# Altium project FT8.PrjPcb
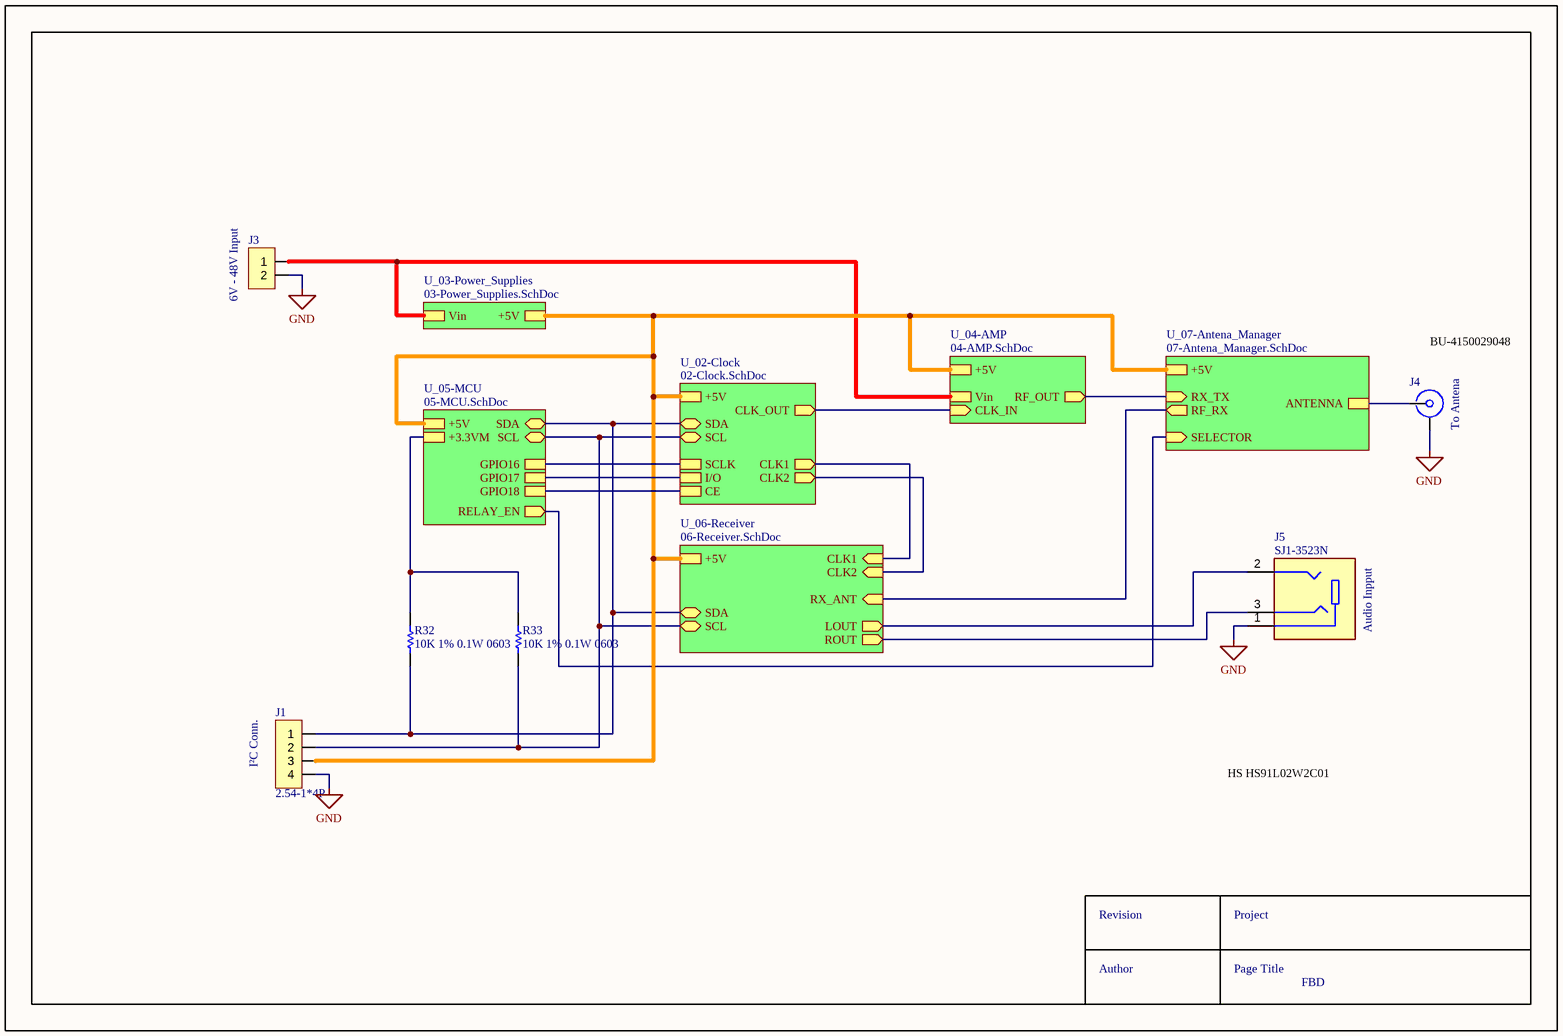
[diagram p0: 01-FBD.SchDoc]
AUTHOR_NAME: CallMeC; BOM_Revision: A; IndusFiles_Revision: 001_A; PCB_Revision: 001_A; Project_Name: RP2040 FT8 TRX; REVISION_VALUE: 001_A
7 sheets, 161 parts. Net scope: hierarchical (ports join the sheet entries above them; power ports are global).
Board file: FT8.PcbDoc
Sheets:
  01-FBD.SchDoc
    U_02-Clock = 02-Clock.SchDoc
    U_04-AMP = 04-AMP.SchDoc
    U_05-MCU = 05-MCU.SchDoc
    U_03-Power_Supplies = 03-Power_Supplies.SchDoc
    U_06-Receiver = 06-Receiver.SchDoc
    U_07-Antena_Manager = 07-Antena_Manager.SchDoc

## Sheet 01-FBD.SchDoc: FBD
size A4; Author: CallMeC; Organization: ORGANIZATION; Address1: ADDRESS 1; Address2: ADDRESS 2; Address3: ADDRESS 3; Address4: ADDRESS 4; Revision: 001_A; SheetNumber: 1; SheetTotal: 7; Title2: OK; Project: RP2040 FT8 TRX; ENG_APP_DATE: --/--/--; DSN_APP_DATE: --/--/--; CHK_APP_DATE: --/--/--

### Parts
J1  2.54-1*4P  [FP-87224-3-MFG]
J3  MX635-6.35-02P-GN01-Cu-PS-A  [MX635-6.35-02P-GN01-Cu-PS-A-Footprint-1]  (value not drawn)
J4  BWSMA-KE-P001  [TE_CONSMA020.062-G]  (value not drawn)
J5  SJ1-3523N  [CUI_SJ1-3523N]
R32  10K 1% 0.1W 0603  [R0603]
R33  10K 1% 0.1W 0603  [R0603]

### Sub-sheets
U_02-Clock = 02-Clock.SchDoc: +5V, SDA (bidir), SCL (bidir), CLK_OUT (out), SCLK, I/O, CE, CLK1 (out), CLK2 (out)
U_03-Power_Supplies = 03-Power_Supplies.SchDoc: Vin, +5V
U_04-AMP = 04-AMP.SchDoc: CLK_IN (in), Vin, RF_OUT (out), +5V
U_05-MCU = 05-MCU.SchDoc: SDA (bidir), SCL (bidir), RELAY_EN (out), +5V, GPIO16, GPIO17, GPIO18, +3.3VM
U_06-Receiver = 06-Receiver.SchDoc: +5V, RX_ANT (in), SDA (bidir), SCL (bidir), LOUT (out), ROUT (out), CLK1 (in), CLK2 (in)
U_07-Antena_Manager = 07-Antena_Manager.SchDoc: RF_RX (out), RX_TX (in), ANTENNA, +5V, SELECTOR (in)

### Nets
ADC_AVDD: R32.2 R33.2 ; sheet U_05-MCU/+3.3VM
GND: J1.4 J3.2 J4.G J5.1
NetC1_2: J1.3 ; sheet U_02-Clock/+5V, sheet U_04-AMP/+5V, sheet U_05-MCU/+5V, sheet U_03-Power_Supplies/+5V, sheet U_06-Receiver/+5V, sheet U_07-Antena_Manager/+5V
NetC8_2: J3.1 ; sheet U_04-AMP/Vin, sheet U_03-Power_Supplies/Vin
NetC24_1: sheet U_04-AMP/RF_OUT, sheet U_07-Antena_Manager/RX_TX
NetC35_2: J5.2 ; sheet U_06-Receiver/LOUT
NetC37_2: J5.3 ; sheet U_06-Receiver/ROUT
NetC68_1: J4.1 ; sheet U_07-Antena_Manager/ANTENNA
NetJ1_1: J1.1 R32.1 ; sheet U_02-Clock/SDA, sheet U_05-MCU/SDA, sheet U_06-Receiver/SDA
NetJ1_2: J1.2 R33.1 ; sheet U_02-Clock/SCL, sheet U_05-MCU/SCL, sheet U_06-Receiver/SCL
NetK1_NC: sheet U_06-Receiver/RX_ANT, sheet U_07-Antena_Manager/RF_RX
NetR19_1: sheet U_05-MCU/RELAY_EN, sheet U_07-Antena_Manager/SELECTOR
NetTP6_0: sheet U_02-Clock/CLK_OUT, sheet U_04-AMP/CLK_IN
NetU2_6: sheet U_02-Clock/CLK2, sheet U_06-Receiver/CLK2
NetU2_9: sheet U_02-Clock/CLK1, sheet U_06-Receiver/CLK1
NetU3_5: sheet U_02-Clock/CE, sheet U_05-MCU/GPIO18
NetU3_6: sheet U_02-Clock/I/O, sheet U_05-MCU/GPIO17
NetU3_7: sheet U_02-Clock/SCLK, sheet U_05-MCU/GPIO16

### Notes on the sheet
- (near J3) 6V - 48V Input
- BU-4150029048
- (near J4) To Antena
- Audio Inpput
- (near J1) I²C Conn.
- HS HS91L02W2C01
- Revision
- Project
- Author
- Page Title

### Library data of the parts
J1 = CMP-002-00121-1: 2.54mm Single Row 3A 4P Bronze -40℃~+105℃ Direct Insert 1x4P Top Square Hole Plugin,P=2.54mm Female Headers ROHS; MFR: BOOMELE(Boom Precision Elec); MFR_Part_#: 2.54-1*4P; LCSC_Part_#: C2718488; LCSC_Price_1ku: 0.026
J3 = CMP-002-00092-2: Copper Alloy 1x2P Tin 6.35mm 4 1 2 -40℃~+105℃ 30A 300V Green 10~26 Straight Plugin,P=6.35mm Screw terminal ROHS; MFR_Part_#: MX635-6.35-02P-GN01-Cu-PS-A; LCSC_Price_1ku: 0.1045; LCSC_Part_#: C5188489
J4 = CMP-543-000000-2: 1 Inner Hole SMA Board-End Staggered pins 50Ω 5.2mm SMD Coaxial Connectors (RF) ROHS; MFR: BAT WIRELESS; MFR_Part_#: BWSMA-KE-P001; LCSC_Price_1lu: 0.2065; LCSC_Part_#: C496550
J5 = CMP-545-000000-2: 3.5 mm, Stereo, Right Angle, Through Hole, 3 Conductors, 0 Internal Switches, Audio Jack Connector; MFR: CUI; LCSC_Part_#: C20182914; LCSC_Price_1ku: 0.6476; MFR_Part_#: SJ1-3523N
R32 R33 = CMP-356-000043-3: Standard Resistor 10K 1% 0.1W 0603; Manufacturer: Generic; MFR_Part_#: 0603WAF1002T5E; TC: 200; Design Item ID: 10K 1% 0.1W 0603; Tolerance: 1%; LCSC_Price_1ku: 0.0007; Value: 10K; PartNumber: 10K 1% 0.1W 0603; LCSC_Part_#: C25804; Component Type: Standard; Source: GT_WH_Control.SCHLIB; Pin Count: 2; Power: 0.1W

## Sheet 02-Clock.SchDoc: Clock
size A4; Author: CallMeC; Organization: ORGANIZATION; Address1: ADDRESS 1; Address2: ADDRESS 2; Address3: ADDRESS 3; Address4: ADDRESS 4; Revision: 001_A; SheetNumber: 2; SheetTotal: 7; Project: RP2040 FT8 TRX; ENG_APP_DATE: --/--/--; DSN_APP_DATE: --/--/--; CHK_APP_DATE: --/--/--
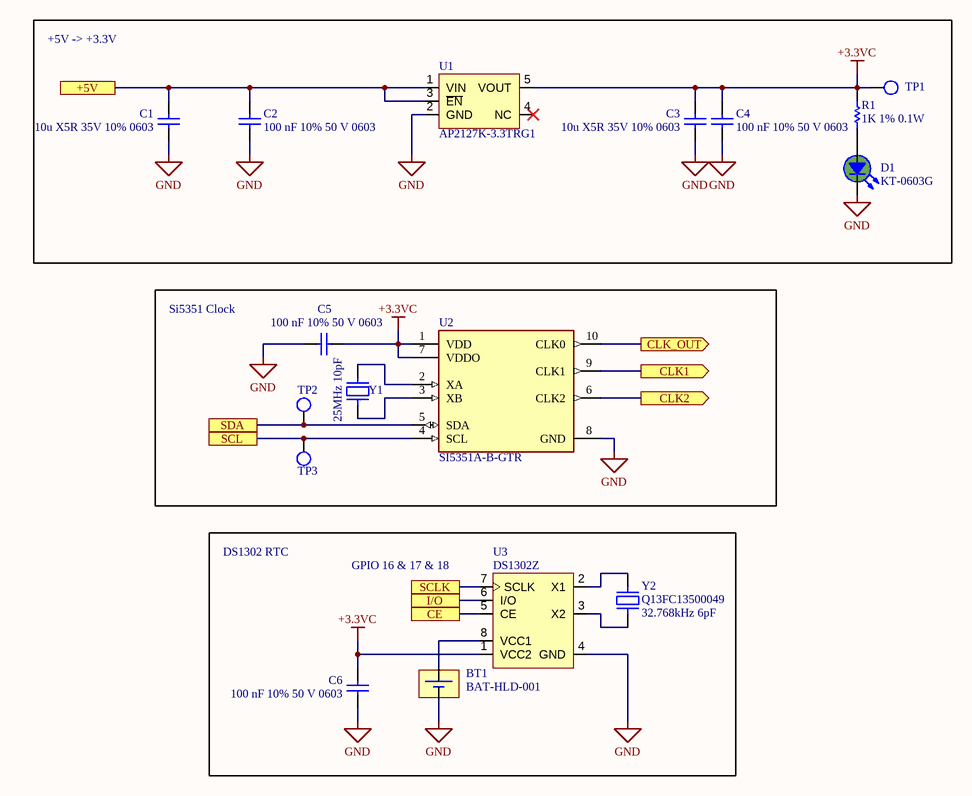
[diagram p1: 02-Clock.SchDoc]

### Parts
BT1  BAT-HLD-001  [BATHLD-001]
C1  10u X5R 35V 10% 0603  [C0603]
C2  100 nF 10% 50 V 0603  [CAPC1608X90X40NL10T20]
C3  10u X5R 35V 10% 0603  [C0603]
C4  100 nF 10% 50 V 0603  [CAPC1608X90X40NL10T20]
C5  100 nF 10% 50 V 0603  [CAPC1608X90X40NL10T20]
C6  100 nF 10% 50 V 0603  [CAPC1608X90X40NL10T20]
D1  KT-0603G  [LED-0603-RED]
R1  1K 1% 0.1W  [R0603]
TP1  Touchpoint  [Touchpoint-Footprint-1]  (value not drawn)  (no BOM)
TP2  Touchpoint  [Touchpoint-Footprint-1]  (value not drawn)  (no BOM)
TP3  Touchpoint  [Touchpoint-Footprint-1]  (value not drawn)  (no BOM)
U1  AP2127K-3.3TRG1  [FP-SOT25-IPC_B]
U2  SI5351A-B-GTR  [FP-SI5351A-B-GTR-IPC_B]
U3  DS1302Z  [SO8]
Y1  value 25MHz 10pF  [X50328MSB2GI-Footprint-1]  (hidden comment: XG1EL89CKI-111YLC-25M)
Y2  Q13FC13500049  value 32.768kHz 6pF  [FP-ABS07-120-MFG]

### Blocks framed on the sheet
+5V -> +3.3V: C1-C4 D1 R1 TP1 U1
Si5351 Clock: C5 TP2 TP3 U2 Y1

### Ports
+5V, CE, CLK1 (out), CLK2 (out), CLK_OUT (out), I/O, SCL, SCLK, SDA

### Nets
+3.3VC: C3.2 C4.2 C5.1 C6.1 R1.1 TP1.0 U1.5(VOUT) U2.1(VDD) U2.7(VDDO) U3.1(VCC2)
GND: BT1.1(-) C1.1 C2.1 C3.1 C4.1 C5.2 C6.2 D1.2 U1.2(GND) U2.8(GND) U3.4(GND)
NetBT1_2: BT1.2(+) U3.8(VCC1)
NetC1_2: C1.2 C2.2 U1.1(VIN) U1.3(~{EN}) ; port +5V
NetD1_1: D1.1 R1.2
NetJ1_1: TP2.0 U2.5(SDA) ; port SDA
NetJ1_2: TP3.0 U2.4(SCL) ; port SCL
NetTP6_0: U2.10(CLK0) ; port CLK_OUT
NetU2_2: U2.2(XA) Y1.2
NetU2_3: U2.3(XB) Y1.1
NetU2_6: U2.6(CLK2) ; port CLK2
NetU2_9: U2.9(CLK1) ; port CLK1
NetU3_2: U3.2(X1) Y2.2
NetU3_3: U3.3(X2) Y2.1
NetU3_5: U3.5(CE) ; port CE
NetU3_6: U3.6(I/O) ; port I/O
NetU3_7: U3.7(SCLK) ; port SCLK

Not connected (* = marked no-connect by the designer): U1 4(NC)*

### Notes on the sheet
- DS1302 RTC
- (near U3) GPIO 16 & 17 & 18
- Revision
- Project
- Author
- Page Title

### Library data of the parts
BT1 = CMP-002-00120-1: CR2032 Phosphor Bronze / Nickel Plated 20 mm Cell Size Battery Holder; MFR: TE Connectivity; LCSC_Price_1ku: 0.4659; MFR_Part_#: BAT-HLD-001; LCSC_Part_#: C7501066
C1 C3 = CMP-001-00153-3: MLCC 10u X5R 35V 10% 0603; MFR_Part_#: GRM188R6YA106MA73D; Manufacturer: Generic; Dielectric: X7R; Component Type: Standard; PartNumber: 10u X5R 35V 10% 0603; Value: 10u; LCSC_Part_#: C194427; Tolerance: 10%; Pin Count: 2; Status: Preferred; Source: GT_WH_Control.SCHLIB; Voltage: 35V; LCSC_Price_1ku: 0.0213; Design Item ID: 10u X5R 35V 10% 0603
C2 C4-C6 = CMP-001-00017-8: Chip Capacitor, 100 nF, +/- 10%, 50 V, 0603 (1608 Metric); MFR_Part_#: CC0603KRX7R9BB104; Voltage Rating: 50V; Value: 100nF; Capacitor Type: Ceramic; Mounting Technology: SM; LCSC_Price_1ku: 0.0015; Pins: 2; RoHS Compliant: True; LCSC_Part_#: C14663; Max Operating Temperature: 125°C; Tolerance: 10%; Case/Package: 0603; Min Operating Temperature: -55°C
D1 = CMP-007-00044-3: 0603 Green LED; MFR_Part_#: KT-0603G; LCSC_Price_1ku: 0.0068; LCSC_Part_#: C12624
R1 = CMP-009-00312-2: Standard Resistor 1K 1% 0.1W 0603; MFR_Part_#: 0603WAF1001T5E; Manufacturer: Generic; TC: 200; Tolerance: 1%; LCSC_Part_#: C21190; Value: 1K; LCSC_Price_1ku: 0.0007; Power: 0.1W; Pin Count: 2; PartNumber: 1K 1% 0.1W 0603; Design Item ID: 1K 1% 0.1W 0603; Component Type: Standard; Source: GT_WH_Control.SCHLIB
TP1-TP3 = CMP-001-0002-2: 60mils touchpoint
U1 = CMP-019-00060-1: IC REG LDO 3.3V 0.3A SOT23-5; MFR: Diodes Incorporated; LCSC_Price_1ku: 0.0388; LCSC_Part_#: C156285; MFR_Part_#: AP2127K-3.3TRG1
U2 = CMP-003-00032-1: IC CLK GENERATOR 160MHZ 10MSOP; MFR_Part_#: SKYWORKS/SILICON LABS; LCSC_Part_#: C504891; MFR: SI5351A-B-GTR; LCSC_Price_1ku: 0.5946
U3 = CMP-023-00001-2: Three-Wire Serial Interface SOP-8 Real Time Clocks ROHS; MFR: JSMSEMI; LCSC_Price_1ku: 0.1005; MFR_Part_#: DS1302Z; LCSC_Part_#: C2900599
Y1 = CMP-003-00033-1: 25MHz Surface Mount Crystal 8pF ±10ppm ±20ppm SMD5032 Crystals ROHS; Manufacturer: YXC; LCSC_Price_1ku: 0.1118; LCSC_Part_#: C19711738; MFR_Part_#: XG1EL89CKI-111YLC-25M
Y2 = CMP-003-00034-2: 32.768kHz Surface Mount Crystal 6pF ±20ppm SMD3215-2P Crystals ROHS; MFR: Seiko Epson; MFR_Part_#: Q13FC13500049; LCSC_Price_1ku: 0.1269; LCSC_Part_#: C95361

## Sheet 04-AMP.SchDoc: Amplifier
size A4; Author: CallMeC; Organization: ORGANIZATION; Address1: ADDRESS 1; Address2: ADDRESS 2; Address3: ADDRESS 3; Address4: ADDRESS 4; Revision: 001_A; SheetNumber: 4; SheetTotal: 7; Project: RP2040 FT8 TRX; ENG_APP_DATE: --/--/--; DSN_APP_DATE: --/--/--; CHK_APP_DATE: --/--/--
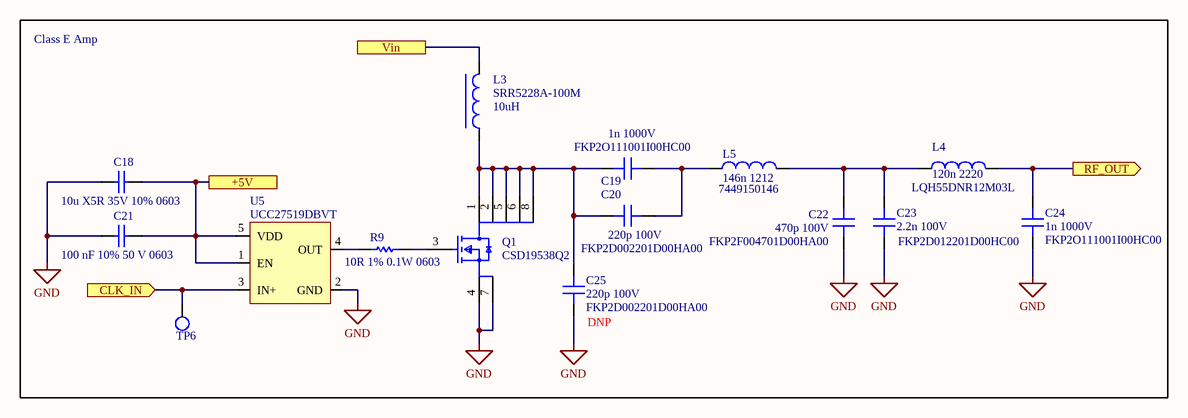
[diagram p2: 04-AMP.SchDoc]

### Parts
C18  10u X5R 35V 10% 0603  [C0603]
C19  FKP2O111001I00HC00  value 1n 1000V  [FKP2O111001I00HC00-Footprint-1]
C20  FKP2D002201D00HA00  value 220p 100V  [FKP2O111001I00HC00-Footprint-1]
C21  100 nF 10% 50 V 0603  [CAPC1608X90X40NL10T20]
C22  FKP2F004701D00HA00  value 470p 100V  [FKP2O111001I00HC00-Footprint-1]
C23  FKP2D012201D00HC00  value 2.2n 100V  [FKP2O111001I00HC00-Footprint-1]
C24  FKP2O111001I00HC00  value 1n 1000V  [FKP2O111001I00HC00-Footprint-1]
C25  FKP2D002201D00HA00  value 220p 100V  [FKP2O111001I00HC00-Footprint-1]
L3  SRR5228A-100M  value 10uH  [INDP5252X32N]
L4  LQH55DNR12M03L  value 120n 2220  [FP-LQH55DN_03-MFG]
L5  7449150146  value 146n 1212  [7449150146]
Q1  CSD19538Q2  [FP-DQK0006C-MFG]
R9  10R 1% 0.1W 0603  [R0603]
TP6  Touchpoint  [Touchpoint-Footprint-1]  (value not drawn)  (no BOM)
U5  UCC27519DBVT  [FP-DBV0005A-IPC_B]

### Ports
+5V, CLK_IN (in), RF_OUT (out), Vin

### Nets
GND: C18.2 C21.2 C22.1 C23.1 C24.2 C25.1 Q1.4(S) Q1.7(S) U5.2(GND)
NetC1_2: C18.1 C21.1 U5.1(EN) U5.5(VDD) ; port +5V
NetC8_2: L3.2 ; port Vin
NetC19_1: C19.1 C20.2 L5.1
NetC19_2: C19.2 C20.1 C25.2 L3.1 Q1.1(D) Q1.2(D) Q1.5(D) Q1.6(D) Q1.8(D)
NetC22_2: C22.2 C23.2 L4.1 L5.2
NetC24_1: C24.1 L4.2 ; port RF_OUT
NetQ1_3: Q1.3(G) R9.2
NetR9_1: R9.1 U5.4(OUT)
NetTP6_0: TP6.0 U5.3(IN+) ; port CLK_IN

### Notes on the sheet
- Class E Amp
- (near C25) DNP
- Revision
- Project
- Author
- Page Title

### Library data of the parts
C18 = CMP-001-00153-3: as C1 on sheet 02-Clock; Component Type: Standard; PartNumber: 10u X5R 35V 10% 0603; Value: 10u; LCSC_Part_#: C194427; Tolerance: 10%; Pin Count: 2; Status: Preferred; Source: GT_WH_Control.SCHLIB; Voltage: 35V; LCSC_Price_1ku: 0.0213; Design Item ID: 10u X5R 35V 10% 0603
C19 C24 = CMP-001-00223-1: Condensateurs à film FKP 2 1000 pF 1000 VDC 6.5x8x7.2 PCM 5; MFR_Part_#: FKP2O111001I00HC00
C20 C25 = CMP-001-00224-1: Condensateurs à film 220 pF 100 VDC 2.5%; MFR_Part_#: FKP2O111001I00HC00
C21 = CMP-001-00017-8: as C2 on sheet 02-Clock; Mounting Technology: SM; LCSC_Price_1ku: 0.0015; Pins: 2; RoHS Compliant: True; LCSC_Part_#: C14663; Max Operating Temperature: 125°C; Tolerance: 10%; Case/Package: 0603; Min Operating Temperature: -55°C
C22 = CMP-001-00225-1: Condensateurs à film 470 pF 250 VDC 2.5%; MFR_Part_#: FKP2F004701D00HA00
C23 = CMP-001-00226-1: Condensateurs à film 2200pF 100 Volt 2.5%; MFR_Part_#: FKP2D012201D00HC00
L3 = CMP-006-00050-1: Inductances de puissance - CMS Ind,5.2x5.2x2.8,10uH+/-20%,2.3A,shd; MFR: Bourns; MFR_Part_#: SRR5228A-100M
L4 = CMP-006-00052-1: Inductor Power Chip Unshielded Wirewound 120nH 20% 1MHz Ferrite 6A 9.8mOhm DCR 2220 T/R; MFR: Murata; LCSC_Part_#: C711154; MFR_Part_#: LQH55DNR12M03L; LCSC_Price_1ku: 0.2902
L5 = CMP-006-00051-1: Inductor, 146Nh, 332Mhz, 19A, 20% Rohs Compliant: Yes; MFR: Wurth Elektronik; MFR_Part_#: 7449150146
Q1 = CMP-013-00050-1: 100-V, N channel NexFET™ power MOSFET, single SON 2 mm x 2 mm, 59 mOhm 6-WSON -55 to 150; LCSC_Part_#: C2838636; LCSC_Price_1ku: 0.3656; MFR_Part_#: CSD19538Q2
R9 = CMP-009-00307-3: Standard Resistor 10R 1% 0.1W 0603; MFR_Part_#: 0603WAF100JT5E; Manufacturer: Generic; TC: 200; Tolerance: 1%; LCSC_Price_1ku: 0.0007; Power: 0.1W; LCSC_Part_#: C22859; Source: GT_WH_Control.SCHLIB; Pin Count: 2; Component Type: Standard; Design Item ID: 100R 1% 0.1W 0603; Value: 10R; PartNumber: 10R 1% 0.1W 0603
TP6 = CMP-001-0002-2: 60mils touchpoint
U5 = CMP-015-00016-1: 4-A/4-A single-channel gate driver with 5-V UVLO, enable, and CMOS input 5-SOT-23 -40 to 140; MFR: Texas Instruments; MFR_Part_#: UCC27519DBVT; LCSC_Part_#: C2676969; LCSC_Price_1ku: 0.5183

## Sheet 05-MCU.SchDoc: MCU
size A4; Author: CallMeC; Organization: ORGANIZATION; Address1: ADDRESS 1; Address2: ADDRESS 2; Address3: ADDRESS 3; Address4: ADDRESS 4; Revision: 001_A; SheetNumber: 5; SheetTotal: 7; Project: RP2040 FT8 TRX; ENG_APP_DATE: --/--/--; DSN_APP_DATE: --/--/--; CHK_APP_DATE: --/--/--
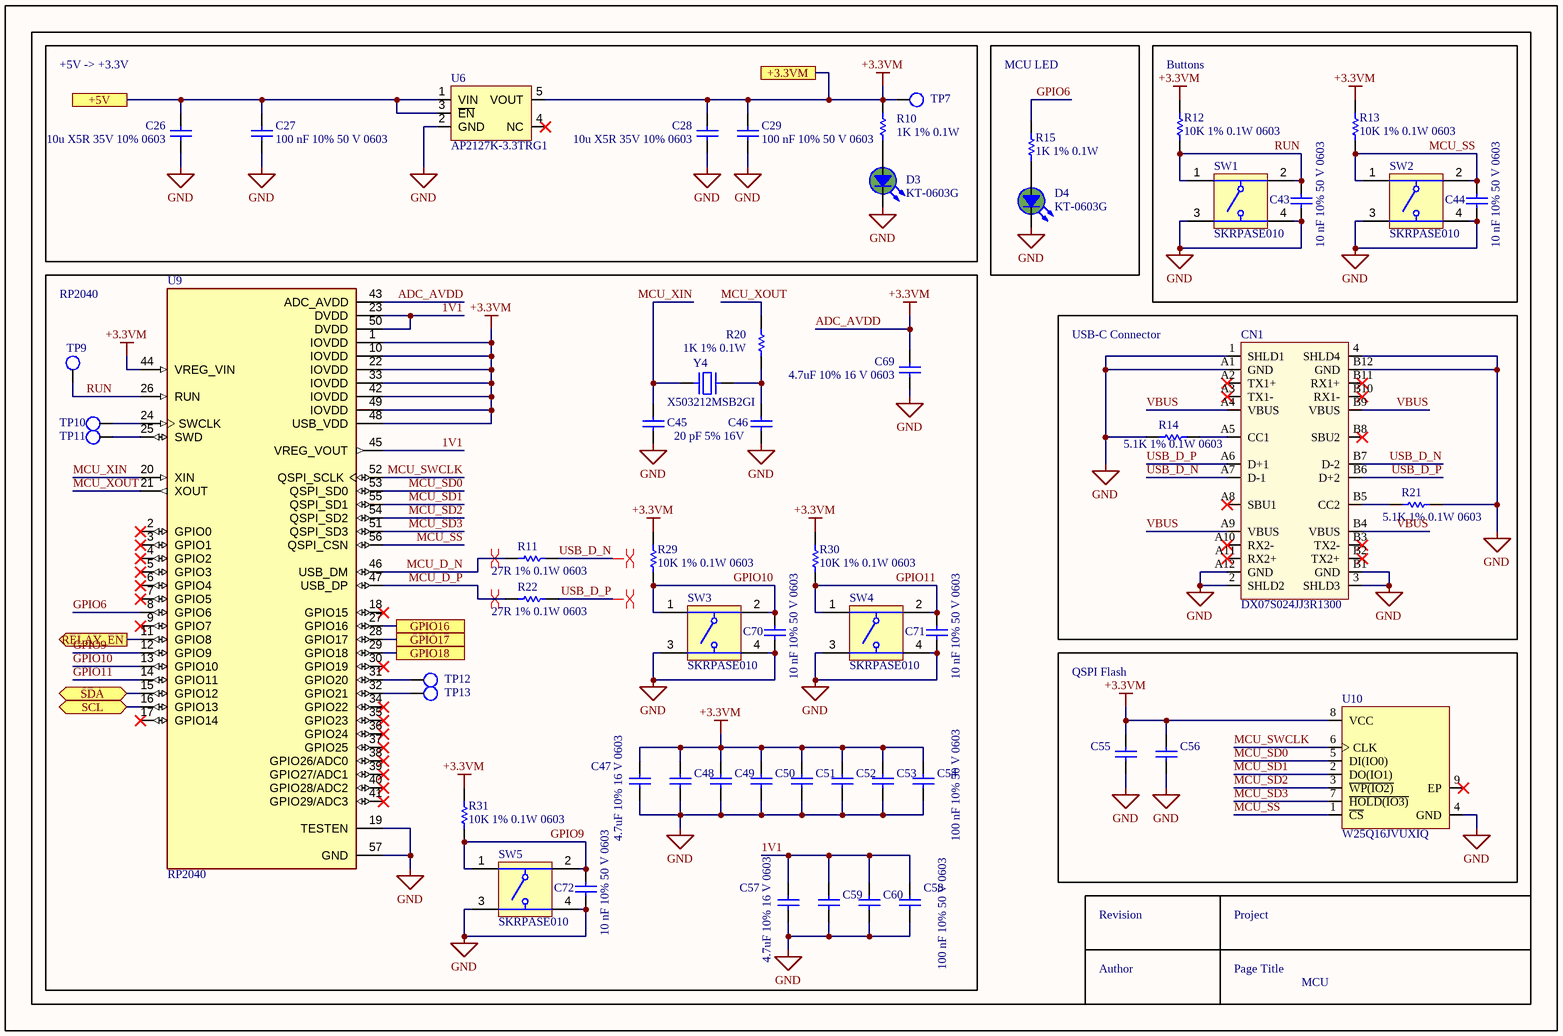
[diagram p3: 05-MCU.SchDoc]

### Parts
C26  10u X5R 35V 10% 0603  [C0603]
C27  100 nF 10% 50 V 0603  [CAPC1608X90X40NL10T20]
C28  10u X5R 35V 10% 0603  [C0603]
C29  100 nF 10% 50 V 0603  [CAPC1608X90X40NL10T20]
C43  10 nF 10% 50 V 0603  [CAPC1608X90X40NL10T20]
C44  10 nF 10% 50 V 0603  [CAPC1608X90X40NL10T20]
C45  20 pF 5% 16V  [CAPC1608X90X40NL10T20]
C46  20 pF +/- 5% 16 V 0603  [CAPC1608X90X40NL10T20]  (value not drawn)
C47  4.7uF 10% 16 V 0603  [CAPC1608X90X40NL10T20]
C48  100 nF 10% 50 V 0603  [CAPC1608X90X40NL10T20]  (value not drawn)
C49  100 nF 10% 50 V 0603  [CAPC1608X90X40NL10T20]  (value not drawn)
C50  100 nF 10% 50 V 0603  [CAPC1608X90X40NL10T20]  (value not drawn)
C51  100 nF 10% 50 V 0603  [CAPC1608X90X40NL10T20]  (value not drawn)
C52  100 nF 10% 50 V 0603  [CAPC1608X90X40NL10T20]  (value not drawn)
C53  100 nF 10% 50 V 0603  [CAPC1608X90X40NL10T20]  (value not drawn)
C54  100 nF 10% 50 V 0603  [CAPC1608X90X40NL10T20]
C55  4.7uF 10% 16 V 0603  [CAPC1608X90X40NL10T20]  (value not drawn)
C56  100 nF 10% 50 V 0603  [CAPC1608X90X40NL10T20]  (value not drawn)
C57  4.7uF 10% 16 V 0603  [CAPC1608X90X40NL10T20]
C58  100 nF 10% 50 V 0603  [CAPC1608X90X40NL10T20]
C59  100 nF 10% 50 V 0603  [CAPC1608X90X40NL10T20]  (value not drawn)
C60  100 nF 10% 50 V 0603  [CAPC1608X90X40NL10T20]  (value not drawn)
C69  4.7uF 10% 16 V 0603  [CAPC1608X90X40NL10T20]
C70  10 nF 10% 50 V 0603  [CAPC1608X90X40NL10T20]
C71  10 nF 10% 50 V 0603  [CAPC1608X90X40NL10T20]
C72  10 nF 10% 50 V 0603  [CAPC1608X90X40NL10T20]
CN1  DX07S024JJ3R1300  [JAE-DX07S024JJ3_V]
D3  KT-0603G  [LED-0603-RED]
D4  KT-0603G  [LED-0603-RED]
R10  1K 1% 0.1W  [R0603]
R11  27R 1% 0.1W 0603  [R0603]
R12  10K 1% 0.1W 0603  [R0603]
R13  10K 1% 0.1W 0603  [R0603]
R14  5.1K 1% 0.1W 0603  [R0603]
R15  1K 1% 0.1W  [R0603]
R20  1K 1% 0.1W  [R0603]
R21  5.1K 1% 0.1W 0603  [R0603]
R22  27R 1% 0.1W 0603  [R0603]
R29  10K 1% 0.1W 0603  [R0603]
R30  10K 1% 0.1W 0603  [R0603]
R31  10K 1% 0.1W 0603  [R0603]
SW1  SKRPASE010  [SKRPASE010]
SW2  SKRPASE010  [SKRPASE010]
SW3  SKRPASE010  [SKRPASE010]
SW4  SKRPASE010  [SKRPASE010]
SW5  SKRPASE010  [SKRPASE010]
TP7  Touchpoint  [Touchpoint-Footprint-1]  (value not drawn)  (no BOM)
TP9  Touchpoint  [Touchpoint-Footprint-1]  (value not drawn)  (no BOM)
TP10  Touchpoint  [Touchpoint-Footprint-1]  (value not drawn)  (no BOM)
TP11  Touchpoint  [Touchpoint-Footprint-1]  (value not drawn)  (no BOM)
TP12  Touchpoint  [Touchpoint-Footprint-1]  (value not drawn)  (no BOM)
TP13  Touchpoint  [Touchpoint-Footprint-1]  (value not drawn)  (no BOM)
U6  AP2127K-3.3TRG1  [FP-SOT25-IPC_B]
U9  RP2040  [QFN40P700X700X90-57N]
U10  W25Q16JVUXIQ  [FP-UX-IPC_B]
Y4  X503212MSB2GI  [X50328MSB2GI-Footprint-1]

### Blocks framed on the sheet
+5V -> +3.3V: C26-C29 D3 R10 TP7 U6
MCU LED: D4 R15
Buttons: C43 C44 R12 R13 SW1 SW2
RP2040: C45-C54 C57-C60 C69-C72 R11 R20 R22 R29-R31 SW3-SW5 TP9-TP13 U9 Y4
USB-C Connector: CN1 R14 R21
QSPI Flash: C55 C56 U10

### Ports
+3.3VM, +5V, GPIO16, GPIO17, GPIO18, RELAY_EN (out), SCL (bidir), SDA (bidir)

### Nets
ADC_AVDD: C28.2 C29.2 C47.2 C48.2 C49.2 C50.2 C51.2 C52.2 C53.2 C54.2 C55.2 C56.2 C69.2 R10.1 R12.2 R13.2 R29.2 R30.2 R31.2 TP7.0 U6.5(VOUT) U9.1(IOVDD) U9.10(IOVDD) U9.22(IOVDD) U9.33(IOVDD) U9.42(IOVDD) U9.43(ADC_AVDD) U9.44(VREG_VIN) U9.48(USB_VDD) U9.49(IOVDD) U10.8(VCC) ; port +3.3VM  [also labelled +3.3VM]
GND: C26.1 C27.1 C28.1 C29.1 C43.1 C44.1 C45.1 C46.1 C47.1 C48.1 C49.1 C50.1 C51.1 C52.1 C53.1 C54.1 C55.1 C56.1 C57.1 C58.1 C59.1 C60.1 C69.1 C70.1 C71.1 C72.1 CN1.1(SHLD1) CN1.2(SHLD2) CN1.3(SHLD3) CN1.4(SHLD4) CN1.A1(GND) CN1.A12(GND) CN1.B1(GND) CN1.B12(GND) D3.2 D4.2 R14.2 R21.1 SW1.3 SW1.4 SW2.3 SW2.4 SW3.3 SW3.4 SW4.3 SW4.4 SW5.3 SW5.4 U6.2(GND) U9.19(TESTEN) U9.57(GND) U10.4(GND)
1V1: C57.2 C58.2 C59.2 C60.2 U9.23(DVDD) U9.45(VREG_VOUT) U9.50(DVDD)
GPIO6: R15.1 U9.8(GPIO6)
GPIO9: C72.2 R31.1 SW5.1 SW5.2 U9.12(GPIO9)
GPIO10: C70.2 R29.1 SW3.1 SW3.2 U9.13(GPIO10)
GPIO11: C71.2 R30.1 SW4.1 SW4.2 U9.14(GPIO11)
MCU_D_N: R11.1 U9.46(USB_DM)
MCU_D_P: R22.1 U9.47(USB_DP)
MCU_SD0: U9.53(QSPI_SD0) U10.5(DI(IO0))
MCU_SD1: U9.55(QSPI_SD1) U10.2(DO(IO1))
MCU_SD2: U9.54(QSPI_SD2) U10.3(~{WP(IO2)})
MCU_SD3: U9.51(QSPI_SD3) U10.7(~{HOLD(IO3)})
MCU_SS: C44.2 R13.1 SW2.1 SW2.2 U9.56(QSPI_CSN) U10.1(~{CS})
MCU_SWCLK: U9.52(QSPI_SCLK) U10.6(CLK)
MCU_XIN: C45.2 U9.20(XIN) Y4.2
MCU_XOUT: R20.2 U9.21(XOUT)
RUN: C43.2 R12.1 SW1.1 SW1.2 TP9.0 U9.26(RUN)
USB_D_N: CN1.A7(D-1) CN1.B7(D-2) R11.2
USB_D_P: CN1.A6(D+1) CN1.B6(D+2) R22.2
VBUS: CN1.A4(VBUS) CN1.A9(VBUS) CN1.B4(VBUS) CN1.B9(VBUS)
NetC1_2: C26.2 C27.2 U6.1(VIN) U6.3(~{EN}) ; port +5V
NetC46_2: C46.2 R20.1 Y4.1
NetCN1_A5: CN1.A5(CC1) R14.1
NetCN1_B5: CN1.B5(CC2) R21.2
NetD3_1: D3.1 R10.2
NetD4_1: D4.1 R15.2
NetJ1_1: U9.15(GPIO12) ; port SDA
NetJ1_2: U9.16(GPIO13) ; port SCL
NetR19_1: U9.11(GPIO8) ; port RELAY_EN
NetTP10_0: TP10.0 U9.24(SWCLK)
NetTP11_0: TP11.0 U9.25(SWD)
NetTP12_0: TP12.0 U9.31(GPIO20)
NetTP13_0: TP13.0 U9.32(GPIO21)
NetU3_5: U9.29(GPIO18) ; port GPIO18
NetU3_6: U9.28(GPIO17) ; port GPIO17
NetU3_7: U9.27(GPIO16) ; port GPIO16

Not connected (* = marked no-connect by the designer): CN1 A2(TX1+)* A3(TX1-)* A8(SBU1)* A10(RX2-)* A11(RX2+)* B2(TX2+)* B3(TX2-)* B8(SBU2)* B10(RX1-)* B11(RX1+)*; U6 4(NC)*; U9 2(GPIO0)* 3(GPIO1)* 4(GPIO2)* 5(GPIO3)* 6(GPIO4)* 7(GPIO5)* 9(GPIO7)* 17(GPIO14)* 18(GPIO15)* 30(GPIO19)* 34(GPIO22)* 35(GPIO23)* 36(GPIO24)* 37(GPIO25)* 38(GPIO26/ADC0)* 39(GPIO27/ADC1)* 40(GPIO28/ADC2)* 41(GPIO29/ADC3)*; U10 9(EP)*

### Layout directives
differential pair: MCU_D_N, MCU_D_P, USB_D_N, USB_D_P

### Notes on the sheet
- Revision
- Project
- Author
- Page Title

### Library data of the parts
C26 C28 = CMP-001-00153-3: as C1 on sheet 02-Clock; Component Type: Standard; PartNumber: 10u X5R 35V 10% 0603; Value: 10u; LCSC_Part_#: C194427; Tolerance: 10%; Pin Count: 2; Status: Preferred; Source: GT_WH_Control.SCHLIB; Voltage: 35V; LCSC_Price_1ku: 0.0213; Design Item ID: 10u X5R 35V 10% 0603
C27 C29 C48-C54 C56 C58-C60 = CMP-001-00017-8: as C2 on sheet 02-Clock; Mounting Technology: SM; LCSC_Price_1ku: 0.0015; Pins: 2; RoHS Compliant: True; LCSC_Part_#: C14663; Max Operating Temperature: 125°C; Tolerance: 10%; Case/Package: 0603; Min Operating Temperature: -55°C
C43 C44 C70-C72 = CMP-001-00194-3: Chip Capacitor, 10 nF, +/- 10%, 50 V, 0603 (1608 Metric); MFR_Part_#: 0603B103K500NT; Voltage Rating: 50V; Value: 10nF; Capacitor Type: Ceramic; Mounting Technology: SM; Case/Package: 0603; LCSC_Part_#: C57112; Max Operating Temperature: 125°C; Min Operating Temperature: -55°C; Tolerance: 10%; LCSC_Price_1ku: 0.0015; Pins: 2; RoHS Compliant: True
C45 C46 = CMP-001-00200-2: Chip Capacitor, 20 pF, +/- 5%, 16V, 0603 (1608 Metric); MFR_Part_#: CC0603JRNPO7BN200; Capacitor Type: Ceramic; Value: 20pF; Tolerance: 5%; Pins: 2; LCSC_Price_1ku: 0.0022; Voltage Rating: 16V; Mounting Technology: SM; LCSC_Part_#: C2190570; Min Operating Temperature: -55°C; Case/Package: 0603; RoHS Compliant: True
C47 C55 C57 C69 = CMP-001-00201-1: Chip Capacitor, 4.7uF, +/- 10%, 16V, 0603 (1608 Metric); MFR_Part_#: CL10A475KO8NNNC; Capacitor Type: Ceramic; LCSC_Part_#: C19666; Voltage Rating: 16V; LCSC_Price_1ku: 0.0063; Pins: 2; RoHS Compliant: True; Value: 4.7uF; Case/Package: 0603; Tolerance: 10%; Min Operating Temperature: -55°C; Max Operating Temperature: 125°C; Mounting Technology: SM
CN1 = CMP-002-00065-4: USB-C Connector, 20 V, 1.25 A, -30 to 80 degC, RoHS, Tape and Reel; Gender: Receptacle; Pins: 28; Connector Type: USB-C
D3 D4 = CMP-007-00044-3: 0603 Green LED; MFR_Part_#: KT-0603G; LCSC_Price_1ku: 0.0068; LCSC_Part_#: C12624
R10 R15 R20 = CMP-009-00312-2: as R1 on sheet 02-Clock; Tolerance: 1%; LCSC_Part_#: C21190; Value: 1K; LCSC_Price_1ku: 0.0007; Power: 0.1W; Pin Count: 2; PartNumber: 1K 1% 0.1W 0603; Design Item ID: 1K 1% 0.1W 0603; Component Type: Standard; Source: GT_WH_Control.SCHLIB
R11 R22 = CMP-009-00348-1: Standard Resistor 27R 1% 0.1W 0603; Manufacturer: Generic; MFR_Part_#: 0603WAJ0270T5E; TC: 200; Power: 0.1W; Source: GT_WH_Control.SCHLIB; Design Item ID: 27R 1% 0.1W 0603; Tolerance: 1%; PartNumber: 27R 1% 0.1W 0603; Value: 27R; Component Type: Standard; Pin Count: 2; LCSC_Part_#: C25224; LCSC_Price_1ku: 0.0007
R12 R13 R29-R31 = CMP-356-000043-3: as R32 on sheet 01-FBD; Design Item ID: 10K 1% 0.1W 0603; Tolerance: 1%; LCSC_Price_1ku: 0.0007; Value: 10K; PartNumber: 10K 1% 0.1W 0603; LCSC_Part_#: C25804; Component Type: Standard; Source: GT_WH_Control.SCHLIB; Pin Count: 2; Power: 0.1W
R14 R21 = CMP-009-00322-2: Standard Resistor 5.1K 1% 0.1W 0603; MFR_Part_#: 0603WAF5101T5E; Manufacturer: Generic; TC: 200; Tolerance: 1%; Source: GT_WH_Control.SCHLIB; Component Type: Standard; LCSC_Price_1ku: 0.0007; Pin Count: 2; Power: 0.1W; Value: 5.1K; PartNumber: 5.1K 1% 0.1W 0603; Design Item ID: 5.1K 1% 0.1W 0603; LCSC_Part_#: C23186
SW1-SW5 = CMP-479-000000-4: Tactile Switches 500mOhm 2.55N 16VDC 4.2X3.2X2.5MM 50mA; Manufacturer_Name: ALPS Electric; Geometry.Height: 2.5mm; Mouser Price/Stock: https://www.mouser.co.uk/ProductDetail/Alps-Alpine/SKRPASE010?qs=byeeYqUIh0NdKk8WD590Nw%3D%3D; Datasheet Link: https://www.mouser.ca/ProductDetail/ALPS/SKRPASE010?qs=byeeYqUIh0NdKk8WD590Nw%3D%3D; Mouser Part Number: 688-SKRPASE010; Manufacturer_Part_Number: SKRPASE010; Design Item ID: SKRPASE010; Source: SKRPASE010.SchLib; LCSC_Part_#: C470427; LCSC_Price_1ku: 0.0694; MFR_Part_#: SKRPASE010
TP7 TP9-TP13 = CMP-001-0002-2: 60mils touchpoint
U6 = CMP-019-00060-1: as U1 on sheet 02-Clock; LCSC_Price_1ku: 0.0388; LCSC_Part_#: C156285; MFR_Part_#: AP2127K-3.3TRG1
U9 = CMP-547-000000-2: 133MHz LQFN-56(7x7) Microcontrollers (MCU/MPU/SOC) ROHS ARM® Cortex®-M0+ MCU 32-Bit; MFR: Raspberry Pi; MFR_Part_#: RP2040; LCSC_Part_#: C2040; LCSC_Price_1ku: 0.6733
U10 = CMP-019-00061-1: 16Mb Serial NOR Flash 133MHz USON8; MFR: Winbond Elec; MFR_Part_#: W25Q16JVUXIQ; LCSC_Part_#: C2843335; LCSC_Price_1ku: 0.2127
Y4 = CMP-003-00035-1: 12MHz Surface Mount Crystal 20pF ±10ppm ±20ppm SMD5032 Crystals ROHS; Manufacturer: YXC; MFR_Part_#: X503212MSB2GI; LCSC_Part_#: C112573; LCSC_Price_1ku: 0.1205

## Sheet 03-Power_Supplies.SchDoc: Power Supplies
size A4; Author: CallMeC; Organization: ORGANIZATION; Address1: ADDRESS 1; Address2: ADDRESS 2; Address3: ADDRESS 3; Address4: ADDRESS 4; Revision: 001_A; SheetNumber: 3; SheetTotal: 7; Project: RP2040 FT8 TRX; ENG_APP_DATE: --/--/--; DSN_APP_DATE: --/--/--; CHK_APP_DATE: --/--/--
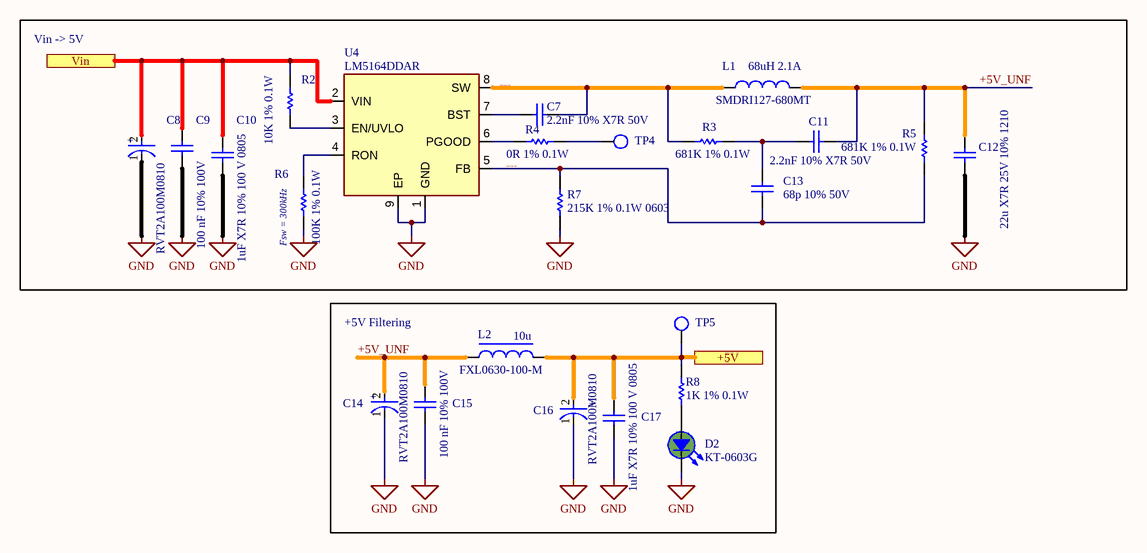
[diagram p4: 03-Power_Supplies.SchDoc]

### Parts
C7  2.2nF 10% X7R 50V  [CAPC1608X90X40NL10T20]
C8  RVT2A100M0810  [FP-SF-MFG]
C9  100 nF 10% 100V  [CAPC1608X90X40NL10T20]
C10  1uF X7R 10% 100 V 0805  [CAPC2013X95X50NL10T25]
C11  2.2nF 10% X7R 50V  [CAPC1608X90X40NL10T20]
C12  22u X7R 25V 10% 1210  [C1210]
C13  68p 10% 50V  [CAPC1608X90X40NL10T20]
C14  RVT2A100M0810  [FP-SF-MFG]
C15  100 nF 10% 100V  [CAPC1608X90X40NL10T20]
C16  RVT2A100M0810  [FP-SF-MFG]
C17  1uF X7R 10% 100 V 0805  [CAPC2013X95X50NL10T25]
D2  KT-0603G  [LED-0603-RED]
L1  SMDRI127-680MT  value 68uH 2.1A  [SUMI-CDRH127_V]
L2  FXL0630-100-M  value 10u  [INDP7066X30N]
R2  10K 1% 0.1W  [R0603]
R3  681K 1% 0.1W  [R0603]
R4  0R 1% 0.1W  [R0603]
R5  681K 1% 0.1W  [R0603]
R6  100K 1% 0.1W  [R0603]
R7  215K 1% 0.1W 0603  [R0603]
R8  1K 1% 0.1W  [R0603]
TP4  Touchpoint  [Touchpoint-Footprint-1]  (value not drawn)  (no BOM)
TP5  Touchpoint  [Touchpoint-Footprint-1]  (value not drawn)  (no BOM)
U4  LM5164DDAR  [FP-DDA0008E-IPC_B]

### Blocks framed on the sheet
Vin -> 5V: C7-C13 L1 R2-R7 TP4 U4
+5V Filtering: C14-C17 D2 L2 R8 TP5

### Ports
+5V, Vin

### Nets
GND: C8.1(C) C9.1 C10.1 C12.1 C14.1(C) C15.1 C16.1(C) C17.1 D2.2 R6.1 R7.1 U4.1(GND) U4.9(EP)
+5V_UNF: C11.1 C12.2 C14.2(A) C15.2 L1.2 L2.1 R5.2
LM5164_FB: C13.1 R5.1 R7.2 U4.5(FB)
LM5164_SW: C7.1 L1.1 R3.2 U4.8(SW)
NetC1_2: C16.2(A) C17.2 L2.2 R8.1 TP5.0 ; port +5V
NetC7_2: C7.2 U4.7(BST)
NetC8_2: C8.2(A) C9.2 C10.2 R2.2 U4.2(VIN) ; port Vin
NetC11_2: C11.2 C13.2 R3.1
NetD2_1: D2.1 R8.2
NetR2_1: R2.1 U4.3(EN/UVLO)
NetR4_1: R4.1 U4.6(PGOOD)
NetR4_2: R4.2 TP4.0
NetR6_2: R6.2 U4.4(RON)

### Notes on the sheet
- (near R6) Fsw = 300kHz
- Revision
- Project
- Author
- Page Title
- (in symbol CMP-001-00218-2) +

### Library data of the parts
C7 C11 = CMP-001-00213-1: Chip Capacitor, 2.2nF, 10%, 50 V, 0603; MFR_Part_#: CC0603KRX7R9BB222; Voltage Rating: 50V; LCSC_Price_1ku: 0.0021; Case/Package: 0603; LCSC_Part_#: C107082; Value: 2.2nF
C8 C14 C16 = CMP-001-00218-2: Cap Aluminum 10uF 100V 20% (8 X 10.2mm) SMD 85mA 2000 hr 85°C T/R; MFR: Honor Elec; LCSC_Price_1ku: 0.0415; LCSC_Part_#: C2895755; MFR_Part_#: RVT2A100M0810
C9 C15 = CMP-001-00209-2: Chip Capacitor, 100 nF, +/- 10%, 100 V, 0603 (1608 Metric); MFR_Part_#: CL10B104KC8NNNC; MFR: Samsung; Capacitor Type: Ceramic; Value: 100nF; Pins: 2; LCSC_Part_#: C15725; Tolerance: 10%; Max Operating Temperature: 125°C; Min Operating Temperature: -55°C; Mounting Technology: SM; Case/Package: 0603; RoHS Compliant: True; LCSC_Price_1ku: 0.0066; Voltage Rating: 100V
C10 C17 = CMP-001-00214-2: Chip Capacitor, 1 uF, X7R 10%, 100 V, 0805; MFR_Part_#: HHV0805R7105K101NSLJ; Capacitor Type: Ceramic; Voltage Rating: 100V; Pins: 2; LCSC_Price_1ku: 0.0246; Tolerance: 10%; Value: 1uF; LCSC_Part_#: C22367837; Case/Package: 0805
C12 = CMP-001-00221-1: MLCC 22u X7R 25V 10% 1210; MFR_Part_#: CL32B226KAJNNNE; PartNumber: 22u X7R 16V 10% 1210; Manufacturer: Generic; Status: Preferred; Voltage: 25V; LCSC_Price_1ku: 0.0679; LCSC_Part_#: C309062; Source: GT_WH_Control.SCHLIB; Pin Count: 2; Tolerance: 10%; Design Item ID: 2u X7R 25V 10% 1210; Dielectric: X7R; Component Type: Standard; Value: 22u
C13 = CMP-001-00202-2: Chip Capacitor, 68pF, +/- 10%, 50 V, 0603 (1608 Metric); MFR_Part_#: CC0603JRNPO9BN680; Capacitor Type: Ceramic; Tolerance: 10%; LCSC_Price_1ku: 0.0019; Max Operating Temperature: 125°C; Voltage Rating: 50V; Min Operating Temperature: -55°C; Pins: 2; RoHS Compliant: True; Case/Package: 0603; Value: 68p; Mounting Technology: SM; LCSC_Part_#: C62782
D2 = CMP-007-00044-3: 0603 Green LED; MFR_Part_#: KT-0603G; LCSC_Price_1ku: 0.0068; LCSC_Part_#: C12624
L1 = CMP-006-00046-1: 2.1A 68uH Shielded inductor ±20% 4A SMD,12.3x12.3mm Power Inductors ROHS; LCSC_Price_1ku: 0.0993; MFR_Part_#: SMDRI127-680MT; LCSC_Part_#: C9907
L2 = CMP-006-00043-1: 4.5A 10uH Molding Choke ±20% 5.5A SMD,6.6x7mm Power Inductors ROHS; LCSC_Part_#: C167223; MFR_Part_#: FXL0630-100-M; LCSC_Price_1ku: 0.0934
R2 = CMP-356-000043-3: Standard Resistor 10K 1% 0.1W 0603; MFR_Part_#: 0603WAF1002T5E; Manufacturer: Generic; TC: 200; Tolerance: 1%; Pin Count: 2; Value: 10K; Power: 0.1W; Design Item ID: 10K 1% 0.1W 0603; LCSC_Price_1ku: 0.0007; Component Type: Standard; LCSC_Part_#: C25804; Source: GT_WH_Control.SCHLIB; PartNumber: 10K 1% 0.1W 0603
R3 R5 = CMP-009-00334-2: Standard Resistor 681K 1% 0.1W 0603; Manufacturer: Generic; MFR_Part_#: 0603WAF6813T5E; Design Item ID: 681K 1% 0.1W 0603; LCSC_Price_1ku: 0.0007; PartNumber: 681K 1% 0.1W 0603; LCSC_Part_#: C23229; Component Type: Standard
R4 = CMP-356-000002-4: Standard Resistor 0R 1% 0.1W 0603; Manufacturer: Generic; MFR_Part_#: 0603WAF0000T5E; PartNumber: 0R1 1% 0.1W 0603; TC: 200; LCSC_Price_1ku: 0.0006; Component Type: Standard; Source: GT_WH_Control.SCHLIB; Tolerance: 1%; Pin Count: 2; LCSC_Part_#: C21189; Power: 0.1W; Design Item ID: 0R 1% 0.1W 0603; Value: 0R
R6 = CMP-009-00306-3: Standard Resistor 100K 1% 0.1W 0603; MFR_Part_#: 0603WAF1003T5E; Manufacturer: Generic; TC: 200; Value: 100K; Tolerance: 1%; Component Type: Standard; PartNumber: 100K 1% 0.1W 0603; LCSC_Price_1ku: 0.0007; Pin Count: 2; Source: GT_WH_Control.SCHLIB; Power: 0.1W; Design Item ID: 100K 1% 0.1W 0603; LCSC_Part_#: C25803
R7 = CMP-009-00347-1: Standard Resistor 215K 1% 0.1W 0603; MFR_Part_#: FRC0603F2153TS; Manufacturer: Generic; Design Item ID: 215K 1% 0.1W 0603; Component Type: Standard; PartNumber: 215K 1% 0.1W 0603; LCSC_Part_#: C5713280; LCSC_Price_1ku: 0.0007
R8 = CMP-009-00312-2: as R1 on sheet 02-Clock; Tolerance: 1%; LCSC_Part_#: C21190; Value: 1K; LCSC_Price_1ku: 0.0007; Power: 0.1W; Pin Count: 2; PartNumber: 1K 1% 0.1W 0603; Design Item ID: 1K 1% 0.1W 0603; Component Type: Standard; Source: GT_WH_Control.SCHLIB
TP4 TP5 = CMP-001-0002-2: 60mils touchpoint
U4 = CMP-019-00058-2: 6-V to 100-V input, 1-A synchronous buck DC-DC converter with ultra-low IQ 8-SO PowerPAD -40 to 150; MFR_Part_#: LM5164DDAR; LCSC_Price_1ku: 0.3281; LCSC_Part_#: C477928

## Sheet 06-Receiver.SchDoc: Receiver
size A4; Author: CallMeC; Organization: ORGANIZATION; Address1: ADDRESS 1; Address2: ADDRESS 2; Address3: ADDRESS 3; Address4: ADDRESS 4; Revision: 001_A; SheetNumber: 6; SheetTotal: 7; Project: RP2040 FT8 TRX; ENG_APP_DATE: --/--/--; DSN_APP_DATE: --/--/--; CHK_APP_DATE: --/--/--
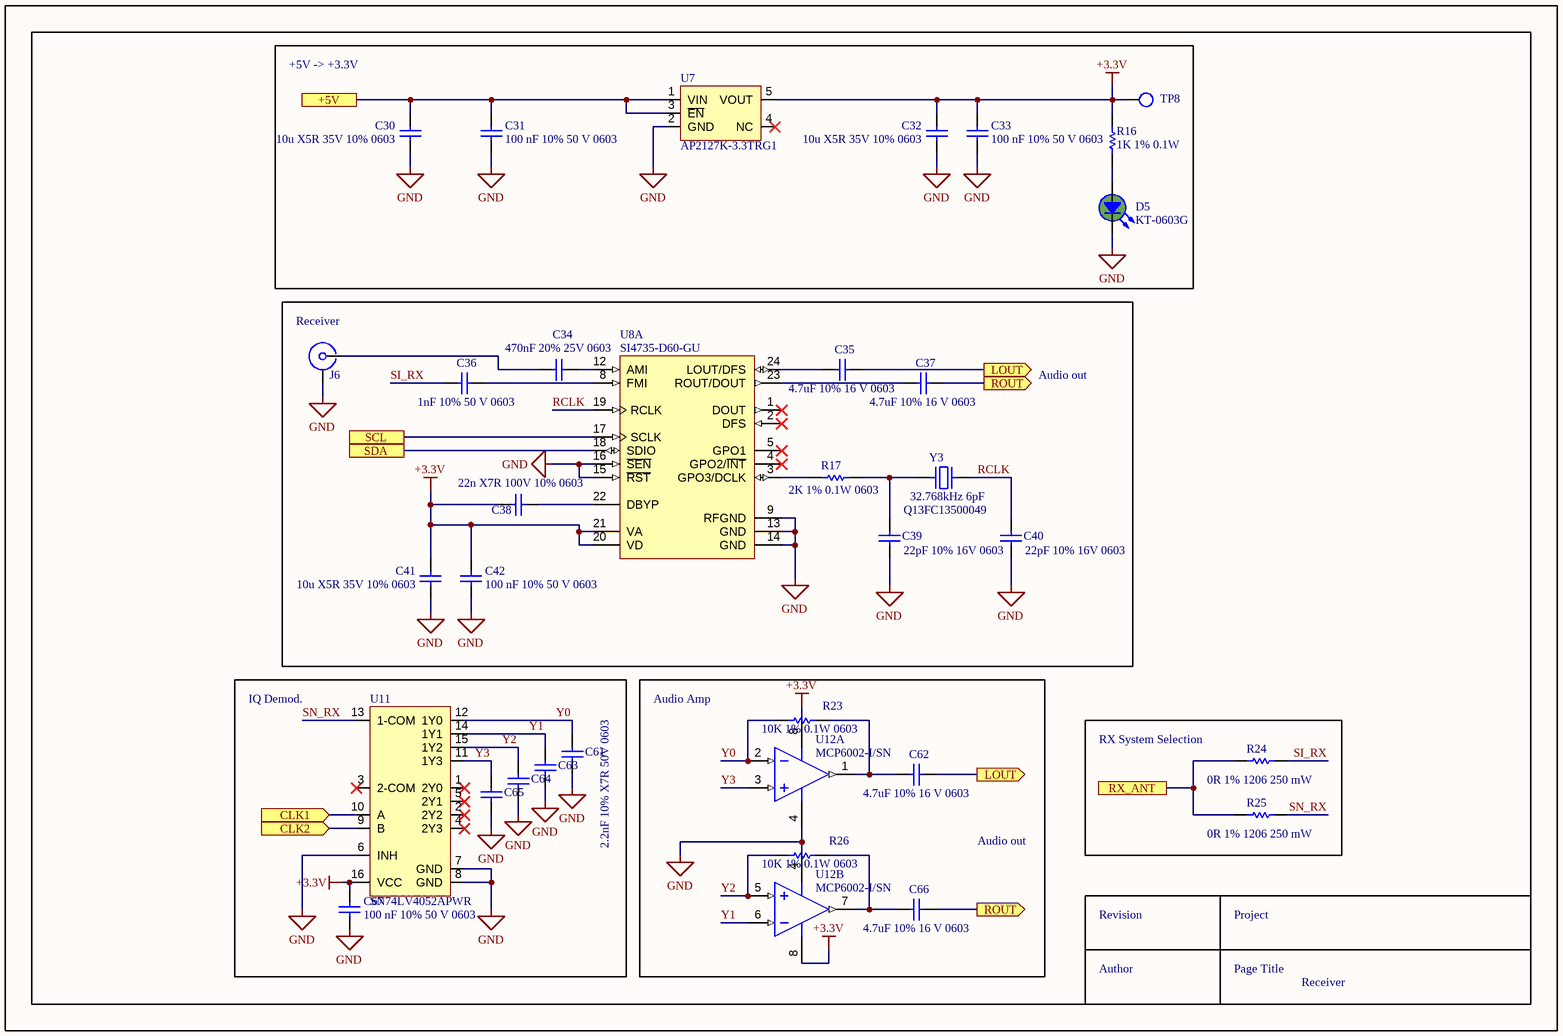
[diagram p5: 06-Receiver.SchDoc]

### Parts
C30  10u X5R 35V 10% 0603  [C0603]
C31  100 nF 10% 50 V 0603  [CAPC1608X90X40NL10T20]
C32  10u X5R 35V 10% 0603  [C0603]
C33  100 nF 10% 50 V 0603  [CAPC1608X90X40NL10T20]
C34  470nF 20% 25V 0603  [CAPC0603(1608)100_L]
C35  4.7uF 10% 16 V 0603  [CAPC1608X90X40NL10T20]
C36  1nF 10% 50 V 0603  [CAPC1608X90X40NL10T20]
C37  4.7uF 10% 16 V 0603  [CAPC1608X90X40NL10T20]
C38  22n X7R 100V 10% 0603  [C0603]
C39  22pF 10% 16V 0603  [CAPC1608X90X40NL10T20]
C40  22pF 10% 16V 0603  [CAPC1608X90X40NL10T20]
C41  10u X5R 35V 10% 0603  [C0603]
C42  100 nF 10% 50 V 0603  [CAPC1608X90X40NL10T20]
C61  2.2nF 10% X7R 50V 0603  [CAPC1608X90X40NL10T20]
C62  4.7uF 10% 16 V 0603  [CAPC1608X90X40NL10T20]
C63  2.2nF 10% X7R 50V 0603  [CAPC1608X90X40NL10T20]  (value not drawn)
C64  2.2nF 10% X7R 50V 0603  [CAPC1608X90X40NL10T20]  (value not drawn)
C65  2.2nF 10% X7R 50V 0603  [CAPC1608X90X40NL10T20]  (value not drawn)
C66  4.7uF 10% 16 V 0603  [CAPC1608X90X40NL10T20]
C67  100 nF 10% 50 V 0603  [CAPC1608X90X40NL10T20]
D5  KT-0603G  [LED-0603-RED]
J6  BWSMA-KE-P001  [TE_CONSMA020.062-G]  (value not drawn)
R16  1K 1% 0.1W  [R0603]
R17  2K 1% 0.1W 0603  [R0603]
R23  10K 1% 0.1W 0603  [R0603]
R24  0R 1% 1206 250 mW  [RESC3116X70X50ML13T20]
R25  0R 1% 1206 250 mW  [RESC3116X70X50ML13T20]
R26  10K 1% 0.1W 0603  [R0603]
TP8  Touchpoint  [Touchpoint-Footprint-1]  (value not drawn)  (no BOM)
U7  AP2127K-3.3TRG1  [FP-SOT25-IPC_B]
U8  SI4735-D60-GU  [SLAB-SSOP-24_N]  (part A of 2)
U11  SN74LV4052APWR  [PW0016A_N]
U12  MCP6002-I/SN  [SOIC-SN8_N]  (parts A,B of 2)
Y3  Q13FC13500049  value 32.768kHz 6pF  [FP-ABS07-120-MFG]

### Blocks framed on the sheet
+5V -> +3.3V: C30-C33 D5 R16 TP8 U7
IQ Demod.: C61 C63-C65 C67 U11
RX System Selection: R24 R25

### Ports
+5V, CLK1 (in), CLK2 (in), LOUT (out), ROUT (out), RX_ANT, SCL, SDA

### Nets
+3.3V: C32.2 C33.2 C38.1 C41.2 C42.2 C67.2 R16.1 TP8.0 U7.5(VOUT) U8.20(VD) U8.21(VA) U11.16(VCC) U12.8(VDD)
GND: C30.1 C31.1 C32.1 C33.1 C39.1 C40.1 C41.1 C42.1 C61.1 C63.1 C64.1 C65.1 C67.1 D5.2 J6.G U7.2(GND) U8.9(RFGND) U8.13(GND) U8.14(GND) U8.15(~{RST}) U8.16(~{SEN}) U11.6(INH) U11.7(GND) U11.8(GND) U12.4(VSS)
RCLK: C40.2 U8.19(RCLK) Y3.1
SI_RX: C36.1 R24.2
SN_RX: R25.2 U11.13(1-COM)
Y0: C61.2 R23.2 U11.12(1Y0) U12.2(VINA-)
Y1: C63.2 U11.14(1Y1) U12.6(VINB-)
Y2: C64.2 R26.2 U11.15(1Y2) U12.5(VINB+)
Y3: C65.2 U11.11(1Y3) U12.3(VINA+)
NetC1_2: C30.2 C31.2 U7.1(VIN) U7.3(~{EN}) ; port +5V
NetC34_1: C34.1 J6.1
NetC34_2: C34.2 U8.12(AMI)
NetC35_1: C35.1 U8.24(LOUT/DFS)
NetC35_2: C35.2 C62.2 ; port LOUT
NetC36_2: C36.2 U8.8(FMI)
NetC37_1: C37.1 U8.23(ROUT/DOUT)
NetC37_2: C37.2 C66.2 ; port ROUT
NetC38_2: C38.2 U8.22(DBYP)
NetC39_2: C39.2 R17.2 Y3.2
NetC62_1: C62.1 R23.1 U12.1(VOUTA)
NetC66_1: C66.1 R26.1 U12.7(VOUTB)
NetD5_1: D5.1 R16.2
NetJ1_1: U8.18(SDIO) ; port SDA
NetJ1_2: U8.17(SCLK) ; port SCL
NetK1_NC: R24.1 R25.1 ; port RX_ANT
NetR17_1: R17.1 U8.3(GPO3/DCLK)
NetU2_6: U11.9(B) ; port CLK2
NetU2_9: U11.10(A) ; port CLK1

Not connected (* = marked no-connect by the designer): U7 4(NC)*; U8 1(DOUT)* 2(DFS)* 4(GPO2/~{INT})* 5(GPO1)*; U11 1(2Y0)* 2(2Y2)* 3(2-COM)* 4(2Y3)* 5(2Y1)*

### Notes on the sheet
- (near J6) Receiver
- Audio out
- Audio Amp
- Revision
- Project
- Author
- Page Title

### Library data of the parts
C30 C32 C41 = CMP-001-00153-3: as C1 on sheet 02-Clock; Component Type: Standard; PartNumber: 10u X5R 35V 10% 0603; Value: 10u; LCSC_Part_#: C194427; Tolerance: 10%; Pin Count: 2; Status: Preferred; Source: GT_WH_Control.SCHLIB; Voltage: 35V; LCSC_Price_1ku: 0.0213; Design Item ID: 10u X5R 35V 10% 0603
C31 C33 C42 C67 = CMP-001-00017-8: as C2 on sheet 02-Clock; Mounting Technology: SM; LCSC_Price_1ku: 0.0015; Pins: 2; RoHS Compliant: True; LCSC_Part_#: C14663; Max Operating Temperature: 125°C; Tolerance: 10%; Case/Package: 0603; Min Operating Temperature: -55°C
C34 = CMP-001-00077-4: Chip Capacitor, 470nF +/-20%, 25V, 0603, Thickness 1 mm; Tolerance: 10%; Voltage Rating: 25V; Min Operating Temperature: -55°C; Pins: 2; Value: 470nF; Case/Package: 0603; Max Operating Temperature: 85°C; Mounting Technology: SMT
C35 C37 C62 C66 = CMP-001-00201-1: as C47 on sheet 05-MCU; LCSC_Part_#: C19666; Voltage Rating: 16V; LCSC_Price_1ku: 0.0063; Pins: 2; RoHS Compliant: True; Value: 4.7uF; Case/Package: 0603; Tolerance: 10%; Min Operating Temperature: -55°C; Max Operating Temperature: 125°C; Mounting Technology: SM
C36 = CMP-001-00203-2: Chip Capacitor, 1 nF, 10%, 50 V, 0603 (1608 Metric); MFR_Part_#: CL10B102KB8NNNC; Capacitor Type: Ceramic; Voltage Rating: 50V; LCSC_Price_1ku: 0.0020; Pins: 2; Case/Package: 0603; Min Operating Temperature: -55°C; Mounting Technology: SM; Value: 1nF; Max Operating Temperature: 125°C; RoHS Compliant: True; LCSC_Part_#: C1588; Tolerance: 10%
C38 = CMP-001-00216-2: MLCC 22n X7R 100V 10% 0603; MFR_Part_#: CC0603KRX7R0BB223; Manufacturer: Generic; Voltage: 100V; Source: GT_WH_Control.SCHLIB; Design Item ID: 22n X7R 100V 10% 0603; LCSC_Price_1ku: 0.0071; Component Type: Standard; LCSC_Part_#: C313105; Tolerance: 10%; Dielectric: X7R; Pin Count: 2; Value: 22n; Status: Preferred; PartNumber: 22n X7R 100V 10% 0603
C39 C40 = CMP-001-00207-2: Chip Capacitor, 22pF, 10%, 16V, 0603 (1608 Metric); MFR_Part_#: C0603C220J4GAC7867; Capacitor Type: Ceramic; Pins: 2; Value: 22pF; Min Operating Temperature: -55°C; Voltage Rating: 16V; LCSC_Price_1ku: 0.0209; Mounting Technology: SM; Max Operating Temperature: 125°C; Tolerance: 10%; LCSC_Part_#: C561800; RoHS Compliant: True; Case/Package: 0603
C61 C63-C65 = CMP-001-00213-1: as C7 on sheet 03-Power_Supplies; Voltage Rating: 50V; LCSC_Price_1ku: 0.0021; Case/Package: 0603; LCSC_Part_#: C107082; Value: 2.2nF
D5 = CMP-007-00044-3: 0603 Green LED; MFR_Part_#: KT-0603G; LCSC_Price_1ku: 0.0068; LCSC_Part_#: C12624
J6 = CMP-543-000000-2: as J4 on sheet 01-FBD; MFR_Part_#: BWSMA-KE-P001; LCSC_Price_1lu: 0.2065; LCSC_Part_#: C496550
R16 = CMP-009-00312-2: as R1 on sheet 02-Clock; Tolerance: 1%; LCSC_Part_#: C21190; Value: 1K; LCSC_Price_1ku: 0.0007; Power: 0.1W; Pin Count: 2; PartNumber: 1K 1% 0.1W 0603; Design Item ID: 1K 1% 0.1W 0603; Component Type: Standard; Source: GT_WH_Control.SCHLIB
R17 = CMP-009-00329-2: Standard Resistor 2K 1% 0.1W 0603; MFR_Part_#: 0603WAF2001T5E; Manufacturer: Generic; TC: 200; PartNumber: 2K 1% 0.1W 0603; LCSC_Price_1ku: 0.0007; LCSC_Part_#: C22975; Pin Count: 2; Source: GT_WH_Control.SCHLIB; Value: 2K; Component Type: Standard; Design Item ID: 2K 1% 0.1W 0603; Power: 0.1W; Tolerance: 1%
R23 R26 = CMP-356-000043-3: as R32 on sheet 01-FBD; Design Item ID: 10K 1% 0.1W 0603; Tolerance: 1%; LCSC_Price_1ku: 0.0007; Value: 10K; PartNumber: 10K 1% 0.1W 0603; LCSC_Part_#: C25804; Component Type: Standard; Source: GT_WH_Control.SCHLIB; Pin Count: 2; Power: 0.1W
R24 R25 = CMP-009-00008-5: Chip Resistor, 0 Ohm, 0.25 W, -55 to 155 degC, 1206 (3216 Metric); Tolerance: 0.05%; Voltage Rating: 200V; Value: 0; Power: 250mW; Pins: 2; Min Operating Temperature: -55°C; RoHS Compliant: True; Max Operating Temperature: 155°C; Mounting Technology: SM; Case/Package: 1206
TP8 = CMP-001-0002-2: 60mils touchpoint
U7 = CMP-019-00060-1: as U1 on sheet 02-Clock; LCSC_Price_1ku: 0.0388; LCSC_Part_#: C156285; MFR_Part_#: AP2127K-3.3TRG1
U8 = CMP-021-00008-1: RF Receiver AM/FM/LW/SW 3.3V/5V Automotive 24-Pin SSOP Tube; MFR: SKYWORKS/SILICON LABS; MFR_Part_#: SI4735-D60-GU; LCSC_Part_#: C1526089; LCSC_Price_1ku: 8.7411
U11 = CMP-016-00014-1: 2 Circuit IC Switch 4:1 75 Ohm 16-TSSOP; MFR: Texas Instruments; LCSC_Part_#: C8142; LCSC_Price_1ku: 0.0974; MFR_Part_#: SN74LV4052APWR
U12 = CMP-014-00007-1: MCP6002 Series 6 V 1 MHz SMT Low-Power Operational Amplifier - SOIC-8; MFR: Microchip Tech; LCSC_Part_#: C116706; MFR_Part_#: MCP6002-I/SN; LCSC_Price_1ku: 0.238
Y3 = CMP-003-00034-2: as Y2 on sheet 02-Clock; MFR_Part_#: Q13FC13500049; LCSC_Price_1ku: 0.1269; LCSC_Part_#: C95361

## Sheet 07-Antena_Manager.SchDoc: Antena Manager
size A4; Author: CallMeC; Organization: ORGANIZATION; Address1: ADDRESS 1; Address2: ADDRESS 2; Address3: ADDRESS 3; Address4: ADDRESS 4; Revision: 001_A; SheetNumber: 7; SheetTotal: 7; Project: RP2040 FT8 TRX; ENG_APP_DATE: --/--/--; DSN_APP_DATE: --/--/--; CHK_APP_DATE: --/--/--
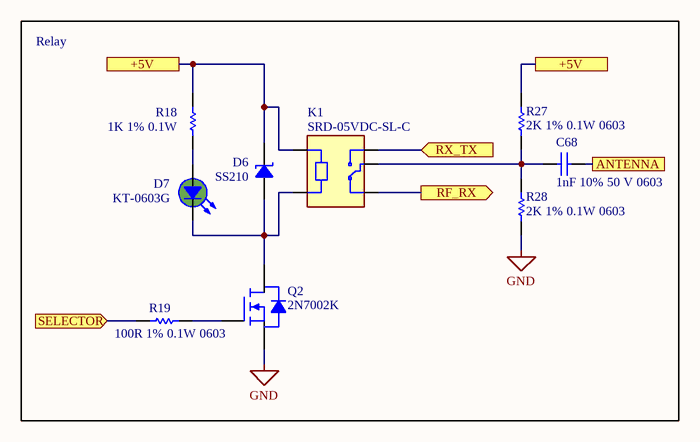
[diagram p6: 07-Antena_Manager.SchDoc]

### Parts
C68  1nF 10% 50 V 0603  [CAPC1608X90X40NL10T20]
D6  SS210  [DO214AC(SMA)]
D7  KT-0603G  [LED-0603-RED]
K1  SRD-05VDC-SL-C  [RELAY_SRD-05VDC-SL-C]
Q2  2N7002K  [FP-318-08-IPC_B]
R18  1K 1% 0.1W  [R0603]
R19  100R 1% 0.1W 0603  [R0603]
R27  2K 1% 0.1W 0603  [R0603]
R28  2K 1% 0.1W 0603  [R0603]

### Blocks framed on the sheet
Relay: C68 D6 D7 K1 Q2 R18 R19 R27 R28

### Ports
+5V, ANTENNA, RF_RX (out), RX_TX (in), SELECTOR (in)

### Nets
GND: Q2.2(S) R28.1
NetC1_2: D6.2 K1.A1 R18.1 R27.2 ; port +5V
NetC24_1: K1.NO ; port RX_TX
NetC68_1: C68.1 ; port ANTENNA
NetC68_2: C68.2 K1.COM R27.1 R28.2
NetD6_1: D6.1 D7.2 K1.A2 Q2.3(D)
NetD7_1: D7.1 R18.2
NetK1_NC: K1.NC ; port RF_RX
NetQ2_1: Q2.1(G) R19.2
NetR19_1: R19.1 ; port SELECTOR

### Notes on the sheet
- Revision
- Project
- Author
- Page Title

### Library data of the parts
C68 = CMP-001-00203-2: as C36 on sheet 06-Receiver; LCSC_Price_1ku: 0.0020; Pins: 2; Case/Package: 0603; Min Operating Temperature: -55°C; Mounting Technology: SM; Value: 1nF; Max Operating Temperature: 125°C; RoHS Compliant: True; LCSC_Part_#: C1588; Tolerance: 10%
D6 = CMP-004-00073-2: Schottky Diode, 2A, 100V, Smb; MFR_Part_#: SS210; LCSC_Part_#: C14996; LCSC_Price_1ku: 0.0124
D7 = CMP-007-00044-3: 0603 Green LED; MFR_Part_#: KT-0603G; LCSC_Price_1ku: 0.0068; LCSC_Part_#: C12624
K1 = CMP-499-000000-2: 5V Trigger Relay Module For Arduino And Raspberry Pi 5V Trigger Relay Module For Arduino And Raspberry Pi; MFR_Part_#: SRD-05VDC-SL-C; LCSC_Price_1ku: 0.18; LCSC_Part_#: C35449
Q2 = CMP-013-00042-1: Mosfet N-ch 60V 300MA SOT23 / Trans Mosfet N-ch 60V 0.3A 3-PIN SOT-23 T/r; MFR_Part_#: 2N7002K; LCSC_Part_#: C5247922; LCSC_Price_1ku: 0.00119
R18 = CMP-009-00312-2: as R1 on sheet 02-Clock; Tolerance: 1%; LCSC_Part_#: C21190; Value: 1K; LCSC_Price_1ku: 0.0007; Power: 0.1W; Pin Count: 2; PartNumber: 1K 1% 0.1W 0603; Design Item ID: 1K 1% 0.1W 0603; Component Type: Standard; Source: GT_WH_Control.SCHLIB
R19 = CMP-009-00305-3: Standard Resistor 100R 1% 0.1W 0603; Manufacturer: Generic; MFR_Part_#: 0603WAF1000T5E; TC: 200; PartNumber: 100R 1% 0.1W 0603; LCSC_Part_#: C22775; Pin Count: 2; Design Item ID: 100R 1% 0.1W 0603; Component Type: Standard; Tolerance: 1%; Value: 100R; Source: GT_WH_Control.SCHLIB; Power: 0.1W; LCSC_Price_1ku: 0.0008
R27 R28 = CMP-009-00329-2: as R17 on sheet 06-Receiver; PartNumber: 2K 1% 0.1W 0603; LCSC_Price_1ku: 0.0007; LCSC_Part_#: C22975; Pin Count: 2; Source: GT_WH_Control.SCHLIB; Value: 2K; Component Type: Standard; Design Item ID: 2K 1% 0.1W 0603; Power: 0.1W; Tolerance: 1%

## Nets that join several sheets
ADC_AVDD: 01-FBD (R32.2 R33.2), 05-MCU (31 pins)
GND: 01-FBD (J1.4 J3.2 J4.G J5.1), 02-Clock (11 pins), 04-AMP (9 pins), 05-MCU (52 pins), 03-Power_Supplies (13 pins), 06-Receiver (25 pins), 07-Antena_Manager (Q2.2 R28.1)
NetC1_2: 01-FBD (J1.3), 02-Clock (C1.2 C2.2 U1.1 U1.3), 04-AMP (C18.1 C21.1 U5.1 U5.5), 05-MCU (C26.2 C27.2 U6.1 U6.3), 03-Power_Supplies (5 pins), 06-Receiver (C30.2 C31.2 U7.1 U7.3), 07-Antena_Manager (D6.2 K1.A1 R18.1 R27.2)
NetC8_2: 01-FBD (J3.1), 04-AMP (L3.2), 03-Power_Supplies (5 pins)
NetC24_1: 04-AMP (C24.1 L4.2), 07-Antena_Manager (K1.NO)
NetC35_2: 01-FBD (J5.2), 06-Receiver (C35.2 C62.2)
NetC37_2: 01-FBD (J5.3), 06-Receiver (C37.2 C66.2)
NetC68_1: 01-FBD (J4.1), 07-Antena_Manager (C68.1)
NetJ1_1: 01-FBD (J1.1 R32.1), 02-Clock (TP2.0 U2.5), 05-MCU (U9.15), 06-Receiver (U8.18)
NetJ1_2: 01-FBD (J1.2 R33.1), 02-Clock (TP3.0 U2.4), 05-MCU (U9.16), 06-Receiver (U8.17)
NetK1_NC: 06-Receiver (R24.1 R25.1), 07-Antena_Manager (K1.NC)
NetR19_1: 05-MCU (U9.11), 07-Antena_Manager (R19.1)
NetTP6_0: 02-Clock (U2.10), 04-AMP (TP6.0 U5.3)
NetU2_6: 02-Clock (U2.6), 06-Receiver (U11.9)
NetU2_9: 02-Clock (U2.9), 06-Receiver (U11.10)
NetU3_5: 02-Clock (U3.5), 05-MCU (U9.29)
NetU3_6: 02-Clock (U3.6), 05-MCU (U9.28)
NetU3_7: 02-Clock (U3.7), 05-MCU (U9.27)

## Assembly variants
Variant of FT8: not fitted C? R? R?